# Altium schematic sheet OpAmpType1.SchDoc: OpAmp Type 1
size 410 x 297 mm; PageSetup: Record=PageOptions|CenterHorizontal=True|CenterVertical=True|PrintScale=1.00|XCorrection=1.00|YCorrection=1.00|PrintKind=1|BorderSize=5000000|LeftOffset=0|BottomOffset=0|Orientation=2|PaperLength=1000|PaperWidth=1000|Scale=100|PaperSource=15|PrintQuality=1200|MediaType=1|DitherType=10|PaperKind=A3|PrintScaleMode=1; Weight: -; ScaleFactor: -; NormInspection: Норм.Контр.; ApprovedBy: Кубатко В.А.; CheckedBy: Кубатко В.А.; Author: Сергеев Д.А.; Organization: ГК "СНАБЖЕНИЕ"; DocumentNumber: OP1177ARZ; SheetNumber: 1; SheetTotal: 1; ENG_APP_DATE: --/--/--; DSN_APP_DATE: --/--/--; CHK_APP_DATE: --/--/--
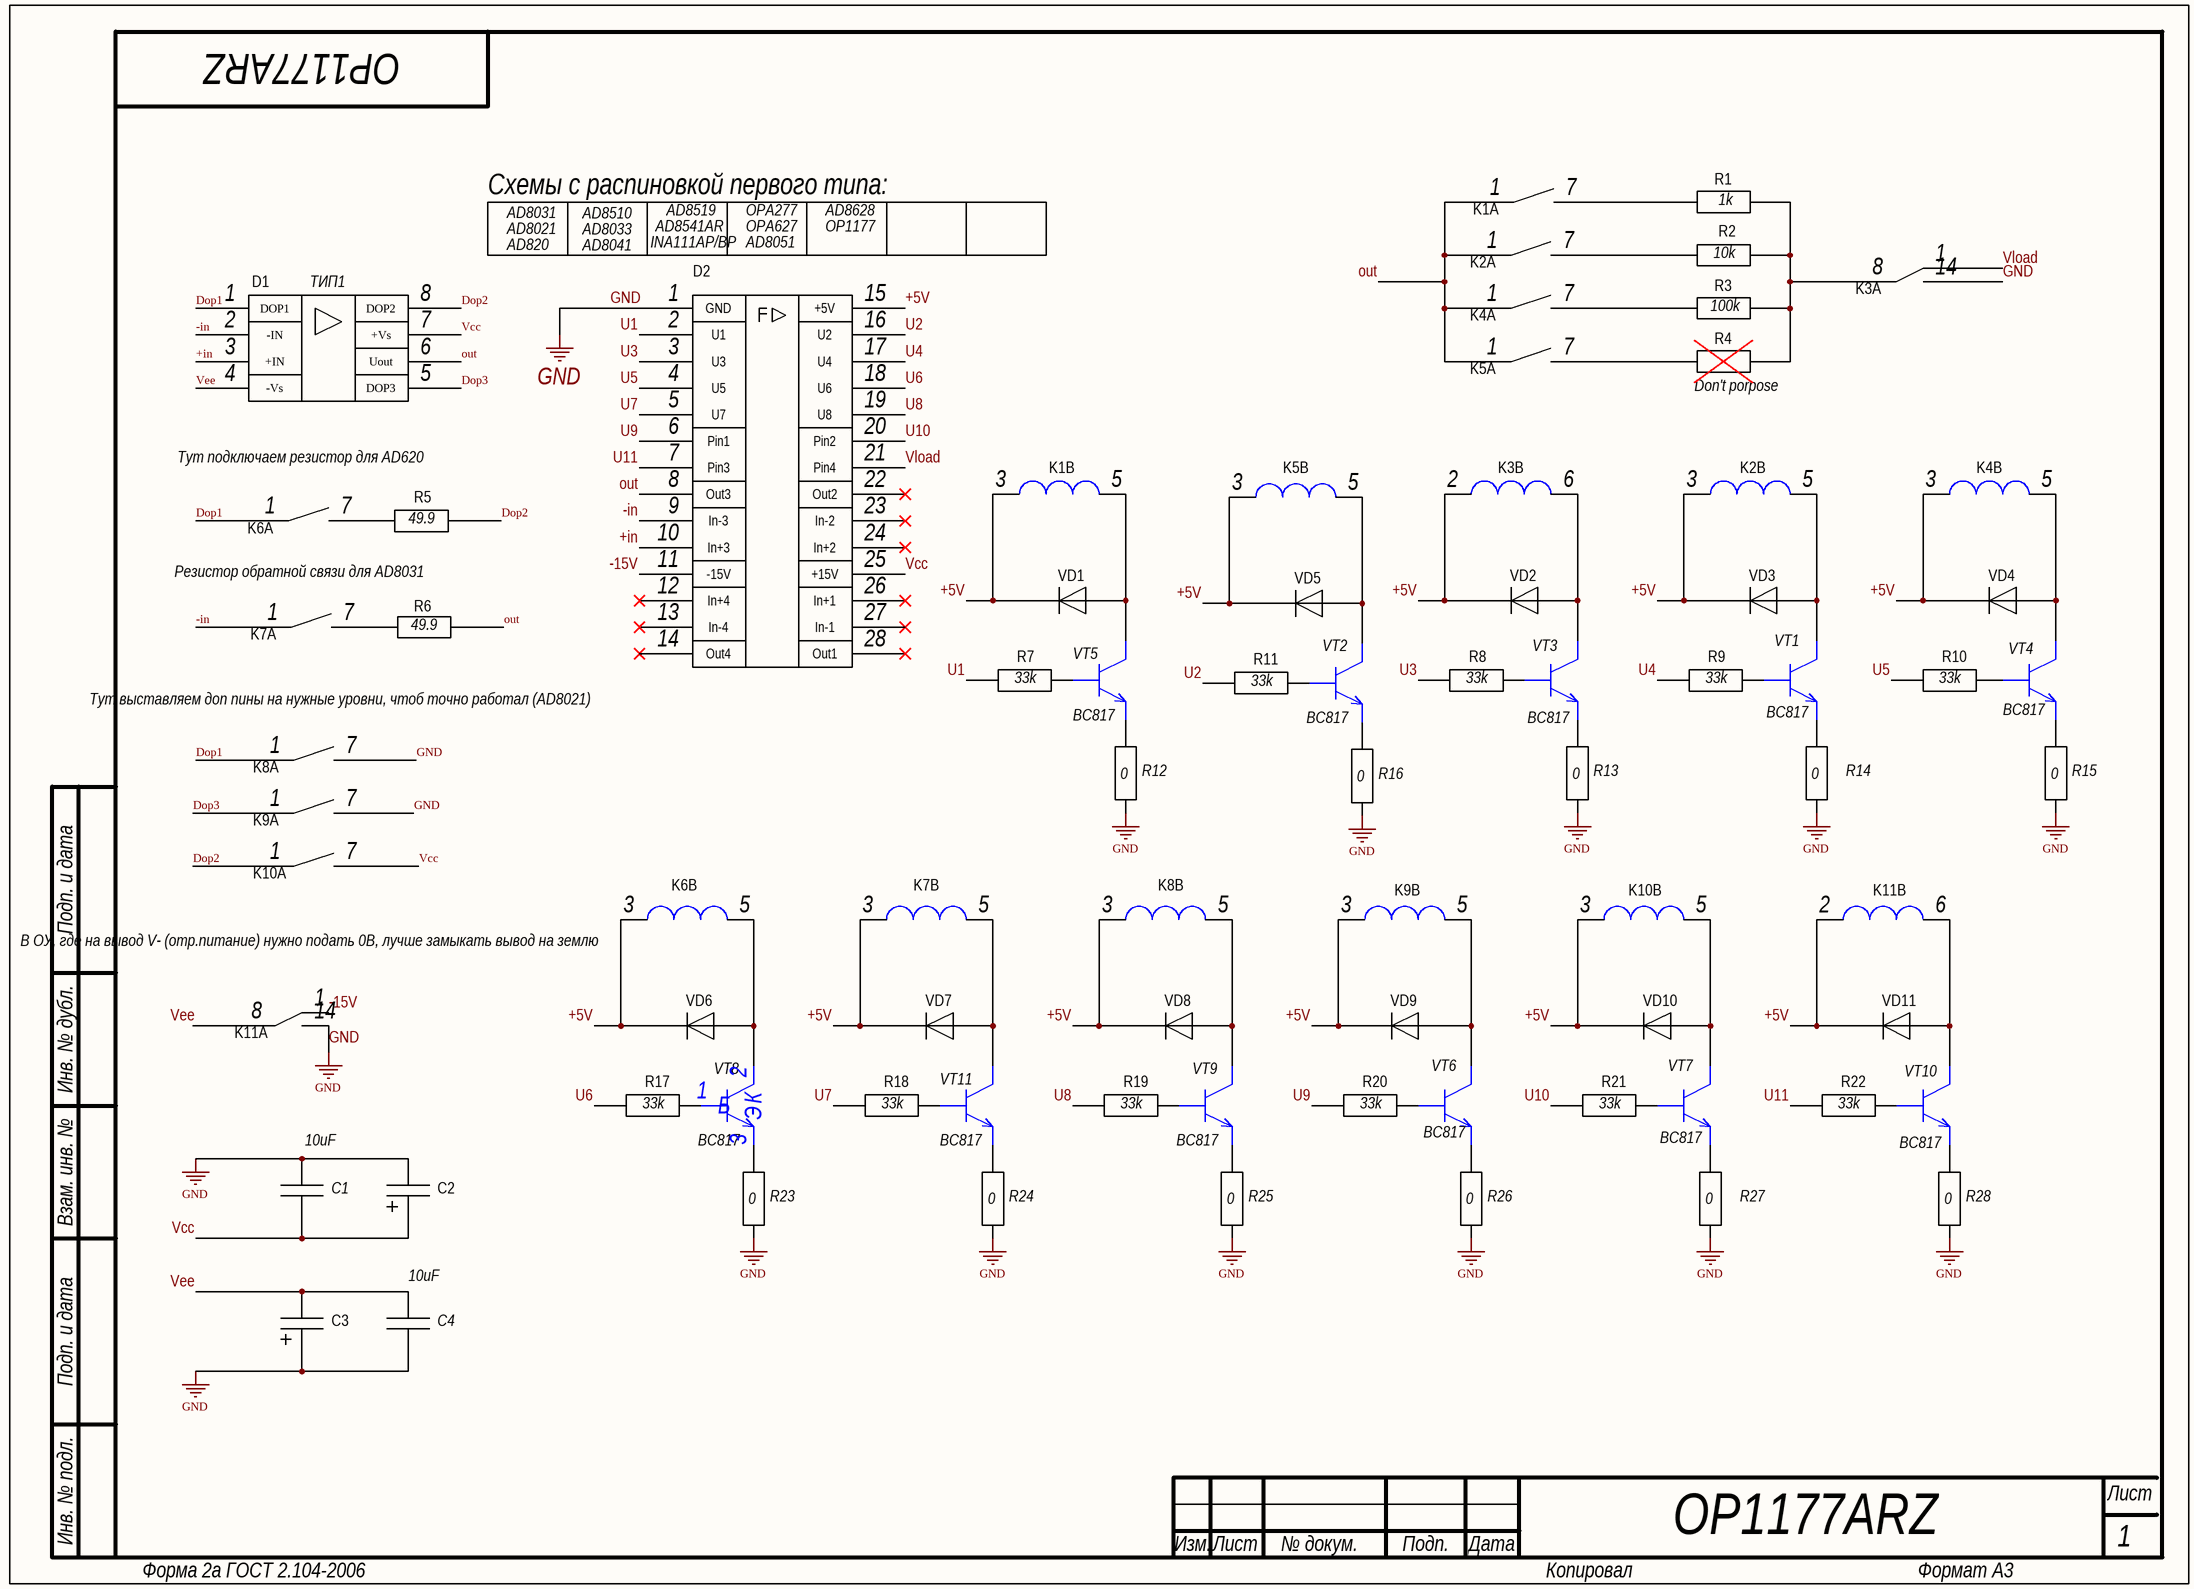
[diagram p0: OpAmpType1.SchDoc]

## Parts
C1  10uF  [0805]
C2  4,7uF  [Tantal Case A]  (value not drawn)
C3  4,7uF  [Tantal Case A]  (value not drawn)
C4  10uF  [0805]
D1  AD8021ARZ  [DIP 14]  (value not drawn)
D2  FORMULA_OP  [Formula_OP]  (value not drawn)
K1  TRR1A05F00  [TRR1A05F00]  (value not drawn)  (parts A,B of 2)
K2  TRR1A05F00  [TRR1A05F00]  (value not drawn)  (parts A,B of 2)
K3  TRR1C05F00  [TRR1С05F00]  (value not drawn)  (parts A,B of 2)
K4  TRR1A05F00  [TRR1A05F00]  (value not drawn)  (parts A,B of 2)
K5  TRR1A05F00  [TRR1A05F00]  (value not drawn)  (parts A,B of 2)
K6  TRR1A05F00  [TRR1A05F00]  (value not drawn)  (parts A,B of 2)
K7  TRR1A05F00  [TRR1A05F00]  (value not drawn)  (parts A,B of 2)
K8  TRR1A05F00  [TRR1A05F00]  (value not drawn)  (parts A,B of 2)
K9  TRR1A05F00  [TRR1A05F00]  (value not drawn)  (parts A,B of 2)
K10  TRR1A05F00  [TRR1A05F00]  (value not drawn)  (parts A,B of 2)
K11  TRR1C05F00  [TRR1С05F00]  (value not drawn)  (parts A,B of 2)
R1  1k  [0805]
R2  10k  [0805]
R3  100k  [0805]
R4  Don't porpose  [0805]
R5  49.9  [0805]
R6  49.9  [0805]
R7  33k  [0805]
R8  33k  [0805]
R9  33k  [0805]
R10  33k  [0805]
R11  33k  [0805]
R12  0  [0805]
R13  0  [0805]
R14  0  [0805]
R15  0  [0805]
R16  0  [0805]
R17  33k  [0805]
R18  33k  [0805]
R19  33k  [0805]
R20  33k  [0805]
R21  33k  [0805]
R22  33k  [0805]
R23  0  [0805]
R24  0  [0805]
R25  0  [0805]
R26  0  [0805]
R27  0  [0805]
R28  0  [0805]
VD1  LL4148  [SOD80C]  (value not drawn)
VD2  LL4148  [SOD80C]  (value not drawn)
VD3  LL4148  [SOD80C]  (value not drawn)
VD4  LL4148  [SOD80C]  (value not drawn)
VD5  LL4148  [SOD80C]  (value not drawn)
VD6  LL4148  [SOD80C]  (value not drawn)
VD7  LL4148  [SOD80C]  (value not drawn)
VD8  LL4148  [SOD80C]  (value not drawn)
VD9  LL4148  [SOD80C]  (value not drawn)
VD10  LL4148  [SOD80C]  (value not drawn)
VD11  LL4148  [SOD80C]  (value not drawn)
VT1  BC817  [SOT-23]
VT2  BC817  [SOT-23]
VT3  BC817  [SOT-23]
VT4  BC817  [SOT-23]
VT5  BC817  [SOT-23]
VT6  BC817  [SOT-23]
VT7  BC817  [SOT-23]
VT8  BC817  [SOT-23]
VT9  BC817  [SOT-23]
VT10  BC817  [SOT-23]
VT11  BC817  [SOT-23]

## Nets
GND: C1.1 C2.2 C3.1 C4.2 D2.1 K3.14 K8.7 K9.7 K11.14 R12.1 R13.1 R14.1 R15.1 R16.1 R23.1 R24.1 R25.1 R26.1 R27.1 R28.1
+5V: D2.15 K1.3 K2.3 K3.2 K4.3 K5.3 K6.3 K7.3 K8.3 K9.3 K10.3 K11.2 VD1.2 VD2.2 VD3.2 VD4.2 VD5.2 VD6.2 VD7.2 VD8.2 VD9.2 VD10.2 VD11.2
+in: D1.3 D2.10
-15V: D2.11 K11.1
-in: D1.2 D2.9 K7.1
Dop1: D1.1 K6.1 K8.1
Dop2: D1.8 K10.1 R5.2
Dop3: D1.5 K9.1
out: D1.6 D2.8 K1.1 K2.1 K4.1 K5.1 R6.2
U1: D2.2 R7.1
U2: D2.16 R11.1
U3: D2.3 R8.1
U4: D2.17 R9.1
U5: D2.4 R10.1
U6: D2.18 R17.1
U7: D2.5 R18.1
U8: D2.19 R19.1
U9: D2.6 R20.1
U10: D2.20 R21.1
U11: D2.7 R22.1
Vcc: C1.2 C2.1 D1.7 D2.25 K10.7
Vee: C3.2 C4.1 D1.4 K11.8
Vload: D2.21 K3.1
NetK1_5: K1.5 VD1.1 VT5.2(К)
NetK1_7: K1.7 R1.1
NetK2_5: K2.5 VD3.1 VT1.2(К)
NetK2_7: K2.7 R2.1
NetK3_6: K3.6 VD2.1 VT3.2(К)
NetK3_8: K3.8 R1.2 R2.2 R3.2 R4.2
NetK4_5: K4.5 VD4.1 VT4.2(К)
NetK4_7: K4.7 R3.1
NetK5_5: K5.5 VD5.1 VT2.2(К)
NetK5_7: K5.7 R4.1
NetK6_5: K6.5 VD6.1 VT8.2(К)
NetK6_7: K6.7 R5.1
NetK7_5: K7.5 VD7.1 VT11.2(К)
NetK7_7: K7.7 R6.1
NetK8_5: K8.5 VD8.1 VT9.2(К)
NetK9_5: K9.5 VD9.1 VT6.2(К)
NetK10_5: K10.5 VD10.1 VT7.2(К)
NetK11_6: K11.6 VD11.1 VT10.2(К)
NetR7_2: R7.2 VT5.1(Б)
NetR8_2: R8.2 VT3.1(Б)
NetR9_2: R9.2 VT1.1(Б)
NetR10_2: R10.2 VT4.1(Б)
NetR11_2: R11.2 VT2.1(Б)
NetR12_2: R12.2 VT5.3(Э)
NetR13_2: R13.2 VT3.3(Э)
NetR14_2: R14.2 VT1.3(Э)
NetR15_2: R15.2 VT4.3(Э)
NetR16_2: R16.2 VT2.3(Э)
NetR17_2: R17.2 VT8.1(Б)
NetR18_2: R18.2 VT11.1(Б)
NetR19_2: R19.2 VT9.1(Б)
NetR20_2: R20.2 VT6.1(Б)
NetR21_2: R21.2 VT7.1(Б)
NetR22_2: R22.2 VT10.1(Б)
NetR23_2: R23.2 VT8.3(Э)
NetR24_2: R24.2 VT11.3(Э)
NetR25_2: R25.2 VT9.3(Э)
NetR26_2: R26.2 VT6.3(Э)
NetR27_2: R27.2 VT7.3(Э)
NetR28_2: R28.2 VT10.3(Э)

Not connected (* = marked no-connect by the designer): D2 12* 13* 14* 22* 23* 24* 26* 27* 28*

## Notes on the sheet
- Схемы с распиновкой первого типа:
- AD8031
- AD8021
- AD820
- AD8510
- AD8033
- AD8041
- INA111AP/BP
- AD8541AR
- AD8519
- OPA277
- OPA627
- AD8051
- AD8628
- OP1177
- (near D1) ТИП1
- Тут подключаем резистор для AD620
- Резистор обратной связи для AD8031
- Тут выставляем доп пины на нужные уровни, чтоб точно работал (AD8021)
- (near K6) В ОУ, где на вывод V- (отр.питание) нужно подать 0В, лучше замыкать вывод на землю
- Подп. и дата
- Инв. № дубл.
- Взам. инв. №
- Инв. № подл.
- Изм.
- Лист
- № докум.
- Подп.
- Дата
- Форма 2а ГОСТ 2.104-2006
- Копировал
- Формат А3
- (in symbol AD8021ARZ) DOP1; DOP2; -IN; +Vs; +IN; Uout; -Vs; DOP3
- (in symbol FORMULA_OP) GND; +5V; U1; U2; U3; U4; U5; U6; U7; U8; Pin1; Pin2; Pin3; Pin4; Out3; Out2; In-3; In-2; In+3; In+2; -15V; +15V; In+4; In+1; In-4; In-1; Out4; Out1

## Library data of the parts
C1 C4 = Cap (0805) AVX: ComponentHeigt: 1.3; Firme: AVX; Leadform: SMD; KIND: Конденсатор; ClassName: *; Component Link: *; ComponentWeigt: *; Packaging: 0805; NN: *; Value: *
C2 C3 = Tantal Case A: ComponentHeigt: 1.6; ComponentWeigt: ??; Firme: AVX; KIND: Конденсатор; Component Link: *; Packaging: R; Value: *; ClassName: *; NN: *
R1-R11 R17-R22 = R0805 Yageo: ComponentHeigt: 0.6; Firme: Yageo; Leadform: SMD; Kind: Резистор; ClassName: *; ComponentWeigt: *; Component Link: *; Packaging: 0805; NN: *; Value: *
R12-R16 R23-R28 = RC0805 Yageo: ComponentHeigt: 0.6; Firme: Yageo; Leadform: SMD; Kind: Резистор; ClassName: *; ComponentWeigt: *; Component Link: *; Packaging: 0805; NN: *; Value: *
VD1-VD11 = BAS32L (SOD-80C)
VT1-VT11 = BC817: Manufacturer: NXP; Type: Транзистор; ID: 16; C-E Voltage: 45V; Collector Current: 500mA; C-E Saturation Voltage: 0.7V; DC Current Gain: 100…600; Total Power Dissipation: 250mW; Transition Frequency: 100MHz; Application Category: 1; Working Temperature Min: -65°С; Working Temperature Max: +150°С; Functional Analog: BC817-40; Published: 07.05.2013; Publisher: Andrew Danich; Part Number: BC817; Value: BC817